# Altium schematic sheet MainController.SchDoc
size A4; SheetNumber: 2; SheetTotal: 5
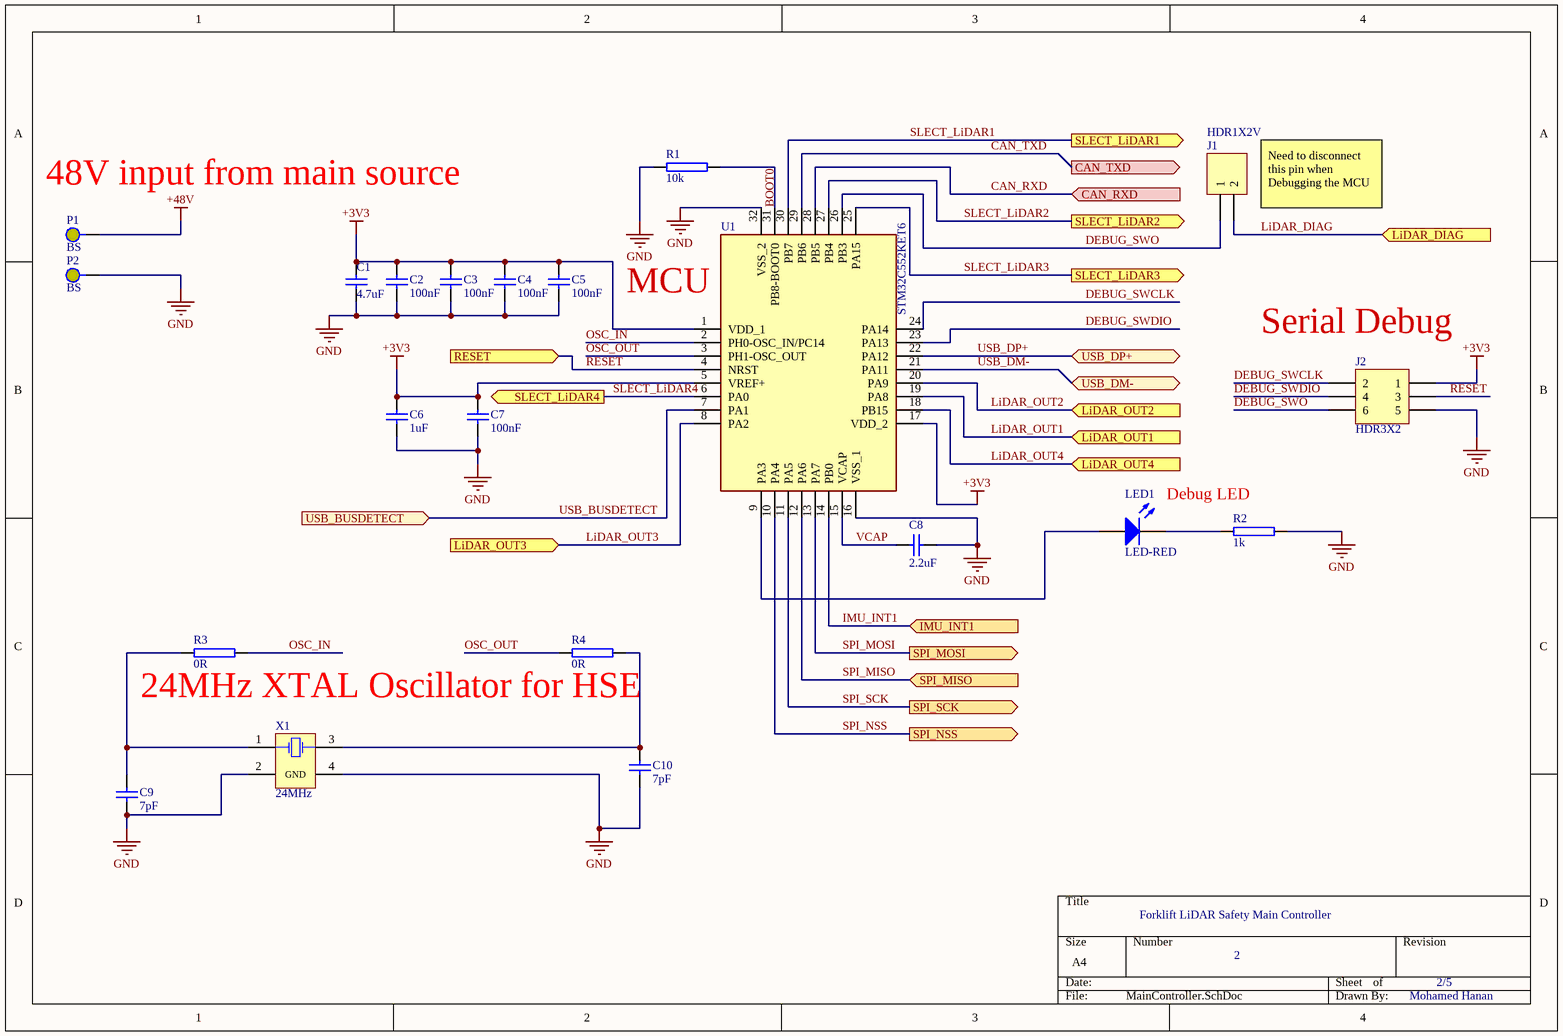
[diagram p0: MainController.SchDoc]

## Parts
C1  4.7uF  [CAP_1206]
C2  100nF  [CAP_0805]
C3  100nF  [CAP_0805]
C4  100nF  [CAP_0805]
C5  100nF  [CAP_0805]
C6  1uF  [CAP_0805]
C7  100nF  [CAP_0805]
C8  2.2uF  [CAP_0805]
C9  7pF  [CAP_0805]
C10  7pF  [CAP_0805]
J1  HDR1X2V  [HDR1X2_AUT]
J2  HDR3X2  [HDR2X3_AUT]
LED1  LED-RED  [LED1206R]
P1  BS  [Banana_AUT]
P2  BS  [Banana_AUT]
R1  10k  [RES_0805]
R2  1k  [RES_1206]
R3  0R  [RES_0805]
R4  0R  [RES_0805]
U1  STM32C552KET6  [32A_M]
X1  24MHz  [CX2520SB]

## Ports
CAN_RXD (in, see ConnectionMain[3B], MainController3[1A]), CAN_TXD (out, see ConnectionMain[3B], MainController3[1A]), IMU_INT1 (in, see ConnectionMain[3B], MainController3[4C]), LiDAR_DIAG (in, see ConnectionMain[3A], MainController2[3B]), LiDAR_OUT1 (in, see ConnectionMain[3B], MainController2[3C]), LiDAR_OUT2 (in, see ConnectionMain[3B], MainController2[3C]), LiDAR_OUT3 (in, see ConnectionMain[3B], MainController2[3D]), LiDAR_OUT4 (in, see ConnectionMain[3B], MainController2[3D]), RESET (in, see ConnectionMain[3C], MainController4[3C]), SLECT_LiDAR1 (out, see ConnectionMain[3A], MainController2[1B]), SLECT_LiDAR2 (out, see ConnectionMain[3A], MainController2[1B]), SLECT_LiDAR3 (out, see ConnectionMain[3A], MainController2[1B]), SLECT_LiDAR4 (out, see ConnectionMain[3B], MainController2[1B]), SPI_MISO (in, see ConnectionMain[3C], MainController3[4B]), SPI_MOSI (out, see ConnectionMain[3C], MainController3[4B]), SPI_NSS (out, see ConnectionMain[3C], MainController3[4B]), SPI_SCK (out, see ConnectionMain[3C], MainController3[4B]), USB_BUSDETECT (in, see ConnectionMain[3B], MainController3[2C]), USB_DM- (bidir, see ConnectionMain[3B], MainController3[2C]), USB_DP+ (bidir, see ConnectionMain[3B], MainController3[2C])

## Nets
+3V3: C1.2 C2.2 C3.2 C4.2 C5.2 C6.2 C7.2 J2.1 U1.1(VDD_1) U1.5(VREF+) U1.17(VDD_2)
+48V: P1.1
GND: C1.1 C2.1 C3.1 C4.1 C5.1 C6.1 C7.1 C8.2 C9.2 C10.2 J2.5 P2.1 R1.1 R2.2 U1.16(VSS_1) U1.32(VSS_2) X1.2(GND) X1.4(GND)
BOOT0: R1.2 U1.31(PB8-BOOT0)
CAN_RXD: U1.28(PB5) ; port CAN_RXD
CAN_TXD: U1.29(PB6) ; port CAN_TXD
DEBUG_SWCLK: J2.2 U1.24(PA14)
DEBUG_SWDIO: J2.4 U1.23(PA13)
DEBUG_SWO: J1.1 J2.6 U1.26(PB3)
IMU_INT1: U1.14(PB0) ; port IMU_INT1
LiDAR_DIAG: J1.2 ; port LiDAR_DIAG
LiDAR_OUT1: U1.19(PA8) ; port LiDAR_OUT1
LiDAR_OUT2: U1.20(PA9) ; port LiDAR_OUT2
LiDAR_OUT3: U1.8(PA2) ; port LiDAR_OUT3
LiDAR_OUT4: U1.18(PB15) ; port LiDAR_OUT4
OSC_IN: R3.2 U1.2(PH0-OSC_IN/PC14)
OSC_OUT: R4.1 U1.3(PH1-OSC_OUT)
RESET: J2.3 U1.4(NRST) ; port RESET
SLECT_LiDAR1: U1.30(PB7) ; port SLECT_LiDAR1
SLECT_LiDAR2: U1.27(PB4) ; port SLECT_LiDAR2
SLECT_LiDAR3: U1.25(PA15) ; port SLECT_LiDAR3
SLECT_LiDAR4: U1.6(PA0) ; port SLECT_LiDAR4
SPI_MISO: U1.12(PA6) ; port SPI_MISO
SPI_MOSI: U1.13(PA7) ; port SPI_MOSI
SPI_NSS: U1.10(PA4) ; port SPI_NSS
SPI_SCK: U1.11(PA5) ; port SPI_SCK
USB_BUSDETECT: U1.7(PA1) ; port USB_BUSDETECT
USB_DM-: U1.21(PA11) ; port USB_DM-
USB_DP+: U1.22(PA12) ; port USB_DP+
VCAP: C8.1 U1.15(VCAP)
NetC9_1: C9.1 R3.1 X1.1(OSC1)
NetC10_1: C10.1 R4.2 X1.3(OSC2)
NetLED1_A: LED1.A U1.9(PA3)
NetLED1_K: LED1.K R2.1

## Notes on the sheet
- (near P1) 48V input from main source
- (near J1) Need to disconnect this pin when Debugging the MCU
- (near U1) MCU
- (near J2) Serial Debug
- Debug LED
- 24MHz XTAL Oscillator for HSE
- Forklift LiDAR Safety Main Controller
- 2
- 2/5
- Mohamed Hanan

## Library data of the parts
C1 = CAPN 1206: Non Polarized Capacitor, SMD, 1206
C2-C10 = CAPN 0805: Non Polarized Capacitor, SMD, 0805
J1 = HDR1X2V: Header, Plug, 2.54mm, 2 Pins, Straight; Supplier 1: Farnell; Supplier Part Number 1: 2254030
J2 = HDR3X2: Header, 3-Pin, Dual row, 2.54mm Pitch, Straight; Supplier 1: Farnell; Supplier Part Number 1: 9733574
LED1 = SMD 1206 LED-RED: RED LED, Case 1206; Supplier 1: Farnell; Supplier Part Number 1: 8530017
P1 P2 = Banana Socket: Banana Socket, 4mm, Panel, Black, 10A; Supplier 1: Farnell; Supplier Part Number 1: 1101113
R1 R3 R4 = Resistor 0805: Resistor, SMD, 0805
R2 = Resistor 1206: Resistor, SMD, 1206
U1 = STM32C552KET6: Arm? Cortex?-M33 32-bit MCU with FPU, 144 MHz, 593 CoreMark?, up to 512Kbyte dualbank flash memory, 128-Kbyte RAM; Manufacturer_Name: STMicroelectronics; Geometry.Height: 1.6mm; Manufacturer_Part_Number: STM32C552KET6; Mouser Part Number: *; Mouser Price/Stock: *; Arrow Part Number: *; Arrow Price/Stock: *; Datasheet Link: https://www.st.com/resource/en/datasheet/stm32c551cc.pdf; Supplier 1: DigiKey; Supplier Part Number 1: 497-STM32C552KET6-ND
X1 = CX2520SB24000D0FLJZZ: Crystals, 24MHz; Supplier 1: Farnell; Supplier Part Number 1: 1657889